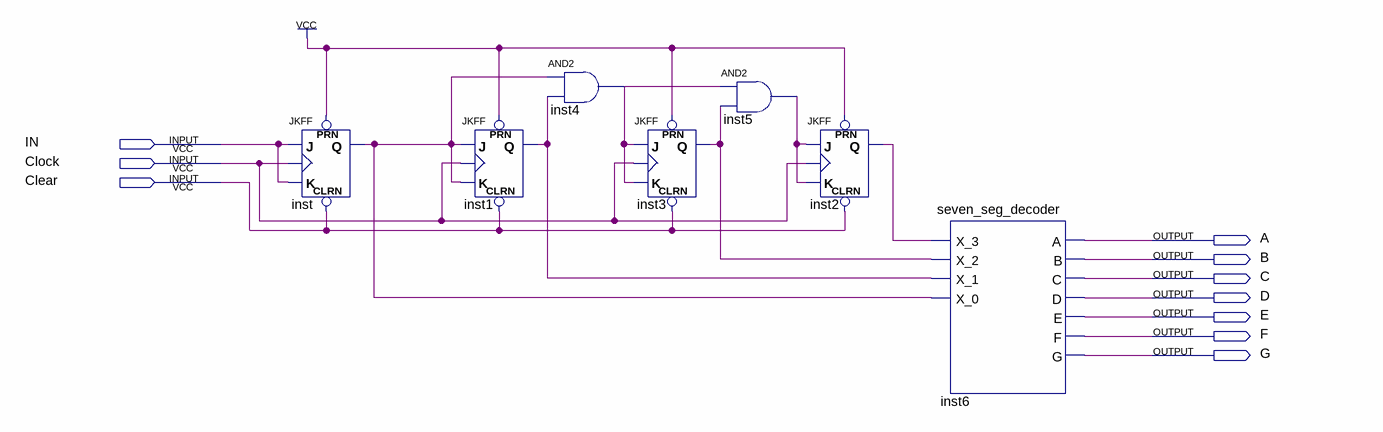
[diagram p0: schematic sheet]
// Quartus schematic lab10step3a.bdf as structural Verilog: 7 symbols, 10 pins
module lab10step3a (
  input  IN,
  input  Clock,
  input  Clear,
  output A,
  output B,
  output C,
  output D,
  output E,
  output F,
  output G
);

  wire inst1_q, inst2_q, inst3_q, inst4_out, inst5_out, inst_q;

  JKFF inst (.PRN(1'b1), .CLRN(Clear), .K(IN), .J(IN), .CLK(Clock), .Q(inst_q));
  JKFF inst1 (.PRN(1'b1), .CLRN(Clear), .K(inst_q), .J(inst_q), .CLK(Clock), .Q(inst1_q));
  and inst4 (inst4_out, inst_q, inst1_q);
  JKFF inst3 (.PRN(1'b1), .CLRN(Clear), .K(inst4_out), .J(inst4_out), .CLK(Clock), .Q(inst3_q));
  and inst5 (inst5_out, inst4_out, inst3_q);
  JKFF inst2 (.PRN(1'b1), .CLRN(Clear), .K(inst5_out), .J(inst5_out), .CLK(Clock), .Q(inst2_q));
  seven_seg_decoder inst6 (
    .X_3(inst2_q), .X_2(inst3_q), .X_1(inst1_q), .X_0(inst_q), .A(A), .B(B), .C(C), .D(D), .E(E), .F(F), .G(G));
endmodule
